# Altium schematic sheet Power_Section.SchDoc (part 1 of 3)
size 420 x 297 mm; SheetNumber: 2; SheetTotal: 3
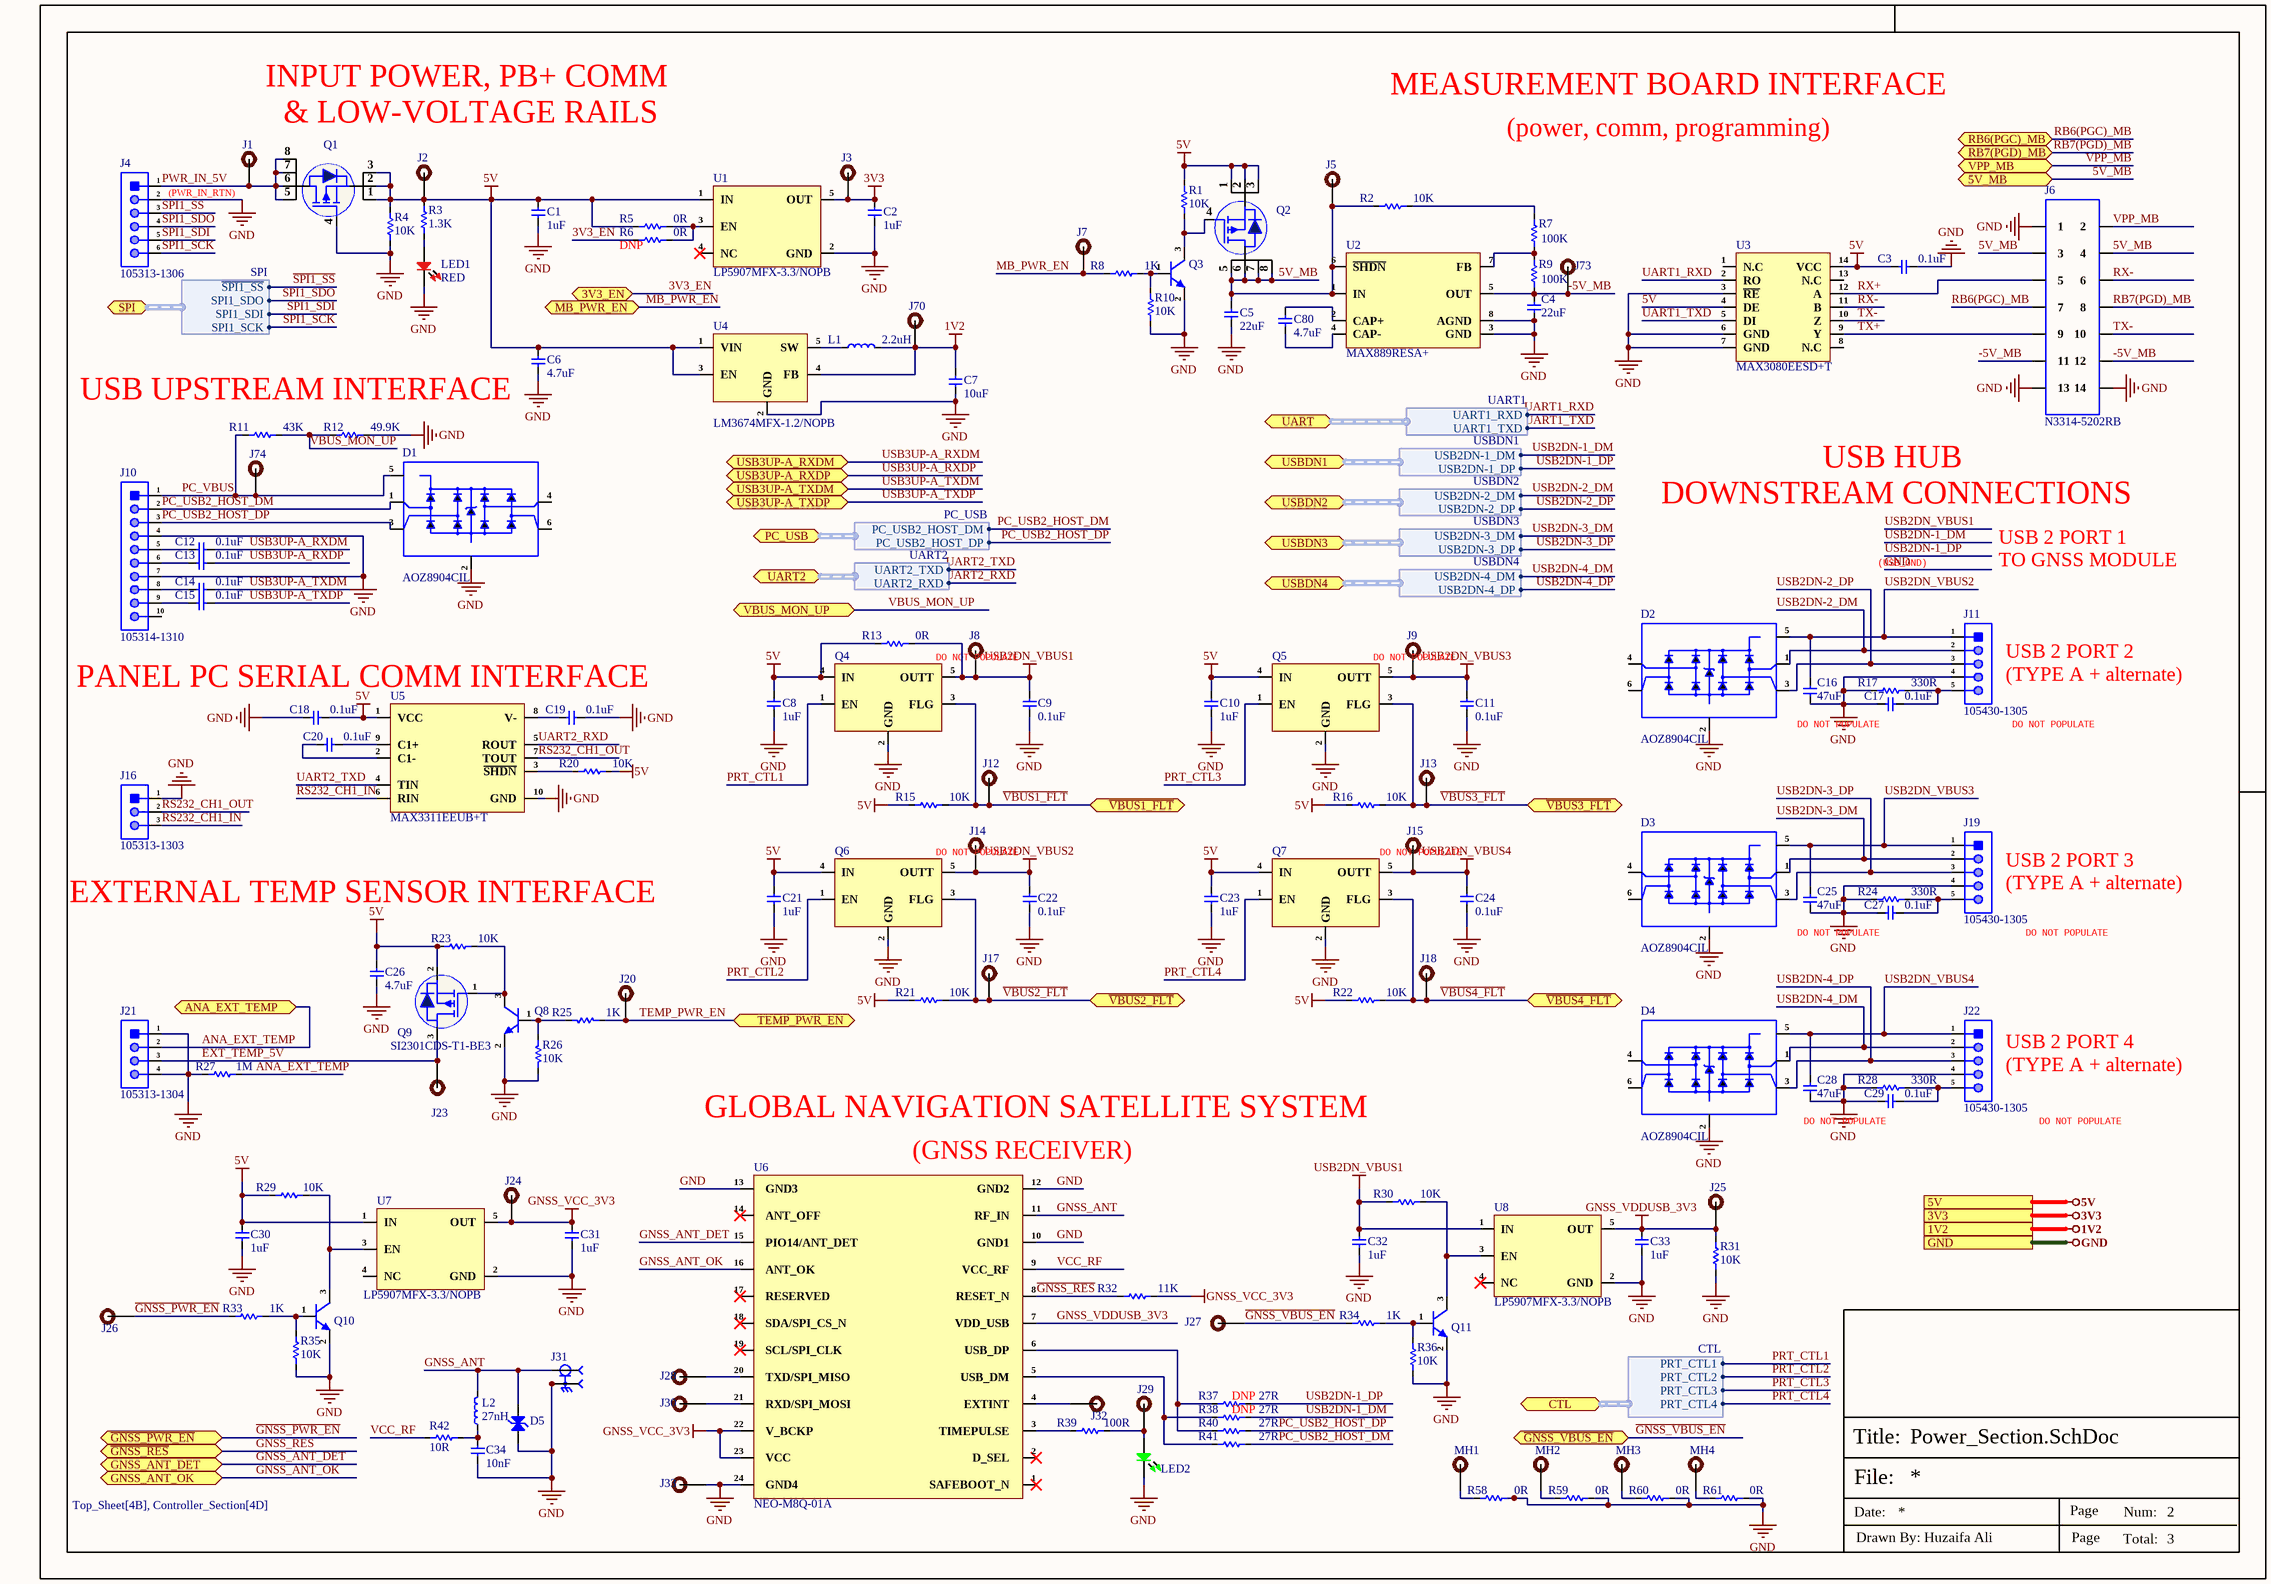
[diagram p0: Power_Section.SchDoc]

## Parts
C1  1uF  [Cap-0402]
C2  1uF  [Cap-0402]
C3  0.1uF  [Cap-0402]
C4  22uF  [Cap-0402]
C5  22uF  [Cap-0402]
C6  4.7uF  [Cap-0402]
C7  10uF  [Cap-0402]
C8  1uF  [Cap-0402]
C9  0.1uF  [Cap-0402]
C10  1uF  [Cap-0402]
C11  0.1uF  [Cap-0402]
C12  0.1uF  [Cap-0402]
C13  0.1uF  [Cap-0402]
C14  0.1uF  [Cap-0402]
C15  0.1uF  [Cap-0402]
C16  47uF  [Cap-0805]
C17  0.1uF  [Cap-0402]
C18  0.1uF  [Cap-0402]
C19  0.1uF  [Cap-0402]
C20  0.1uF  [Cap-0402]
C21  1uF  [Cap-0402]
C22  0.1uF  [Cap-0402]
C23  1uF  [Cap-0402]
C24  0.1uF  [Cap-0402]
C25  47uF  [Cap-0805]
C26  4.7uF  [Cap-0402]
C27  0.1uF  [Cap-0402]
C28  47uF  [Cap-0805]
C29  0.1uF  [Cap-0402]
C30  1uF  [Cap-0402]
C31  1uF  [Cap-0402]
C32  1uF  [Cap-0402]
C33  1uF  [Cap-0402]
C34  10nF  [Cap-0603]
C80  4.7uF  [Cap-0402]
D1  AOZ8904CIL  [SOT-23-6]
D2  AOZ8904CIL  [SOT-23-6]
D3  AOZ8904CIL  [SOT-23-6]
D4  AOZ8904CIL  [SOT-23-6]
D5  ACPDQC3V3HT-HF  [Diode 0402]  (value not drawn)
J1  Test Point -TH 1.8mm Hole size 0.92mm  [Test Point -TH 1.8mm Hole size 0.92mm]  (value not drawn)  (no BOM)
J2  Test Point -TH 1.8mm Hole size 0.92mm  [Test Point -TH 1.8mm Hole size 0.92mm]  (value not drawn)  (no BOM)
J3  Test Point -TH 1.8mm Hole size 0.92mm  [Test Point -TH 1.8mm Hole size 0.92mm]  (value not drawn)  (no BOM)
J4  105313-1306  [1053131306]
J5  Test Point -TH 1.8mm Hole size 0.92mm  [Test Point -TH 1.8mm Hole size 0.92mm]  (value not drawn)  (no BOM)
J6  N3314-5202RB  [N3314-5202RB]
J7  Test Point -TH 1.8mm Hole size 0.92mm  [Test Point -TH 1.8mm Hole size 0.92mm]  (value not drawn)  (no BOM)
J8  Test Point -TH 1.8mm Hole size 0.92mm  [Test Point -TH 1.8mm Hole size 0.92mm]  (value not drawn)  (no BOM)
J9  Test Point -TH 1.8mm Hole size 0.92mm  [Test Point -TH 1.8mm Hole size 0.92mm]  (value not drawn)  (no BOM)
J10  105314-1310  [1053141310]
J11  105430-1305  [1054301305]
J12  Test Point -TH 1.8mm Hole size 0.92mm  [Test Point -TH 1.8mm Hole size 0.92mm]  (value not drawn)  (no BOM)
J13  Test Point -TH 1.8mm Hole size 0.92mm  [Test Point -TH 1.8mm Hole size 0.92mm]  (value not drawn)  (no BOM)
J14  Test Point -TH 1.8mm Hole size 0.92mm  [Test Point -TH 1.8mm Hole size 0.92mm]  (value not drawn)  (no BOM)
J15  Test Point -TH 1.8mm Hole size 0.92mm  [Test Point -TH 1.8mm Hole size 0.92mm]  (value not drawn)  (no BOM)
J16  105313-1303  [1053131303]
J17  Test Point -TH 1.8mm Hole size 0.92mm  [Test Point -TH 1.8mm Hole size 0.92mm]  (value not drawn)  (no BOM)
J18  Test Point -TH 1.8mm Hole size 0.92mm  [Test Point -TH 1.8mm Hole size 0.92mm]  (value not drawn)  (no BOM)
J19  105430-1305  [1054301305]
J20  Test Point -TH 1.8mm Hole size 0.92mm  [Test Point -TH 1.8mm Hole size 0.92mm]  (value not drawn)  (no BOM)
J21  105313-1304  [1053131304]
J22  105430-1305  [1054301305]
J23  Test Point -TH 1.8mm Hole size 0.92mm  [Test Point -TH 1.8mm Hole size 0.92mm]  (value not drawn)  (no BOM)
J24  Test Point -TH 1.8mm Hole size 0.92mm  [Test Point -TH 1.8mm Hole size 0.92mm]  (value not drawn)  (no BOM)
J25  Test Point -TH 1.8mm Hole size 0.92mm  [Test Point -TH 1.8mm Hole size 0.92mm]  (value not drawn)  (no BOM)
J26  Test Point -TH 1.8mm Hole size 0.92mm  [Test Point -TH 1.8mm Hole size 0.92mm]  (value not drawn)  (no BOM)
J27  Test Point -TH 1.8mm Hole size 0.92mm  [Test Point -TH 1.8mm Hole size 0.92mm]  (value not drawn)  (no BOM)
J28  Test Point -TH 1.8mm Hole size 0.92mm  [Test Point -TH 1.8mm Hole size 0.92mm]  (value not drawn)  (no BOM)
J29  Test Point -TH 1.8mm Hole size 0.92mm  [Test Point -TH 1.8mm Hole size 0.92mm]  (value not drawn)  (no BOM)
J30  Test Point -TH 1.8mm Hole size 0.92mm  [Test Point -TH 1.8mm Hole size 0.92mm]  (value not drawn)  (no BOM)
J31  SMA-J-P-H-ST-TH1  [SMA-J-P-H-ST-TH1]  (value not drawn)
J32  Test Point -TH 1.8mm Hole size 0.92mm  [Test Point -TH 1.8mm Hole size 0.92mm]  (value not drawn)  (no BOM)
J33  Test Point -TH 1.8mm Hole size 0.92mm  [Test Point -TH 1.8mm Hole size 0.92mm]  (value not drawn)  (no BOM)
J70  Test Point -TH 1.8mm Hole size 0.92mm  [Test Point -TH 1.8mm Hole size 0.92mm]  (value not drawn)  (no BOM)
J73  Test Point -TH 1.8mm Hole size 0.92mm  [Test Point -TH 1.8mm Hole size 0.92mm]  (value not drawn)  (no BOM)
J74  Test Point -TH 1.8mm Hole size 0.92mm  [Test Point -TH 1.8mm Hole size 0.92mm]  (value not drawn)  (no BOM)
L1  2.2uH  [NR3012T2R2M]
L2  27nH  [IND-0603 (1608 Metric)]
LED1  RED  [LED-0603]
LED2  Emerald  [LED-0603]  (value not drawn)
MH1  M4 Mounting Hole  [M4 Mounting Hole]  (value not drawn)  (no BOM)
MH2  M4 Mounting Hole  [M4 Mounting Hole]  (value not drawn)  (no BOM)
MH3  M4 Mounting Hole  [M4 Mounting Hole]  (value not drawn)  (no BOM)
MH4  M4 Mounting Hole  [M4 Mounting Hole]  (value not drawn)  (no BOM)
Q1  SI4463DY  [SOIC-8]  (value not drawn)
Q2  SI4463DY  [SOIC-8]  (value not drawn)
Q3  MMBT2222ATT3G  [MMBT2222ATT3G]  (value not drawn)
Q4  AP22816BKAWT-7  [TSOT-25]  (value not drawn)
Q5  AP22816BKAWT-7  [TSOT-25]  (value not drawn)
Q6  AP22816BKAWT-7  [TSOT-25]  (value not drawn)
Q7  AP22816BKAWT-7  [TSOT-25]  (value not drawn)
Q8  MMBT2222ATT3G  [MMBT2222ATT3G]  (value not drawn)
Q9  SI2301CDS-T1-BE3  [SOT-23]
Q10  MMBT2222ATT3G  [MMBT2222ATT3G]  (value not drawn)
Q11  MMBT2222ATT3G  [MMBT2222ATT3G]  (value not drawn)
R1  10K  [Res-0402]
R2  10K  [Res-0402]
R3  1.3K  [Res-0402]
R4  10K  [Res-0402]
R5  0R  [Res-0402]
R6  0R  [Res-0402]
R7  100K  [Res-0402]
R8  1K  [Res-0402]
R9  100K  [Res-0402]
R10  10K  [Res-0402]
R11  43K  [Res-0402]
R12  49.9K  [Res-0402]
R13  0R  [Res-0402]
R15  10K  [Res-0402]
R16  10K  [Res-0402]
R17  330R  [Res-0402]
R20  10K  [Res-0402]
R21  10K  [Res-0402]
R22  10K  [Res-0402]
R23  10K  [Res-0402]
R24  330R  [Res-0402]
R25  1K  [Res-0402]
R26  10K  [Res-0402]
R27  1M  [Res-0402]
R28  330R  [Res-0402]
R29  10K  [Res-0402]
R30  10K  [Res-0402]
R31  10K  [Res-0402]
R32  11K  [Res-0402]
R33  1K  [Res-0402]
R34  1K  [Res-0402]
R35  10K  [Res-0402]
R36  10K  [Res-0402]
R37  27R  [Res-0402]
R38  27R  [Res-0402]
R39  100R  [Res-0402]
R40  27R  [Res-0402]
R41  27R  [Res-0402]
R42  10R  [Res-0402]
R58  0R  [Res-0805]
R59  0R  [Res-0805]
R60  0R  [Res-0805]
R61  0R  [Res-0805]
U1  LP5907MFX-3.3/NOPB  [SOT-23-5]
U2  MAX889RESA+  [SOIC-8(0.154", 3.90mm Width)]
U3  MAX3080EESD+T  [SOIC-14]
U4  LM3674MFX-1.2/NOPB  [SOT-23-5]
U5  MAX3311EEUB+T  [10-MSOP]
U6  NEO-M8Q-01A  [NEO-M8Q-01A]
U7  LP5907MFX-3.3/NOPB  [SOT-23-5]
U8  LP5907MFX-3.3/NOPB  [SOT-23-5]

## Ports
1V2 (see Top_Sheet[3A], Controller_Section[4D]), 3V3 (see Top_Sheet[3A], Controller_Section[4D]), 3V3_EN (bidir, see Top_Sheet[3B], Controller_Section[5C]), 5V (see Top_Sheet[3A], Controller_Section[4D]), 5V_MB (bidir, see Top_Sheet[3B], Controller_Section[4C]), ANA_EXT_TEMP (bidir, see Top_Sheet[4A], Controller_Section[4C]), CTL (bidir, harness CTL, see Top_Sheet[3C], Controller_Section[5D]), GND (see Top_Sheet[4C], Controller_Section[4D]), GNSS_ANT_DET (bidir, see Top_Sheet[4B], Controller_Section[4C]), GNSS_ANT_OK (bidir, see Top_Sheet[4B], Controller_Section[4D]), MB_PWR_EN (bidir, see Top_Sheet[3B], Controller_Section[4C]), PC_USB (bidir, harness PC_USB, see Top_Sheet[3C], Controller_Section[5C]), RB6(PGC)_MB (bidir, see Top_Sheet[3B], Controller_Section[4C]), RB7(PGD)_MB (bidir, see Top_Sheet[3B], Controller_Section[4C]), SPI (bidir, harness SPI, see Top_Sheet[3C], Controller_Section[5C]), TEMP_PWR_EN (bidir, see Top_Sheet[4B], Controller_Section[4D]), UART2 (bidir, harness UART2, see Top_Sheet[3C], Controller_Section[5C]), UART (bidir, harness UART1, see Top_Sheet[3C], Controller_Section[5C]), USB3UP-A_RXDM (bidir, see Top_Sheet[3B], Controller_Section[4C]), USB3UP-A_RXDP (bidir, see Top_Sheet[3B], Controller_Section[4C]), USB3UP-A_TXDM (bidir, see Top_Sheet[3B], Controller_Section[4C]), USB3UP-A_TXDP (bidir, see Top_Sheet[3B], Controller_Section[4C]), USBDN1 (bidir, harness USBDN1, see Top_Sheet[3C], Controller_Section[5C]), USBDN2 (bidir, harness USBDN2, see Top_Sheet[3C], Controller_Section[5C]), USBDN3 (bidir, harness USBDN3, see Top_Sheet[3C], Controller_Section[5C]), USBDN4 (bidir, harness USBDN4, see Top_Sheet[3C], Controller_Section[5C]), VBUS_MON_UP (bidir, see Top_Sheet[3C], Controller_Section[4C]), VPP_MB (bidir, see Top_Sheet[3B], Controller_Section[4C]), ~{GNSS_PWR_EN} (bidir, see Top_Sheet[4A], Controller_Section[4C]), ~{GNSS_RES} (bidir, see Top_Sheet[4B], Controller_Section[4C]), ~{GNSS_VBUS_EN} (bidir, see Top_Sheet[3B], Controller_Section[4C]), ~{VBUS1_FLT} (bidir, see Top_Sheet[3B], Controller_Section[4C]), ~{VBUS2_FLT} (bidir, see Top_Sheet[3B], Controller_Section[4C]), ~{VBUS3_FLT} (bidir, see Top_Sheet[3B], Controller_Section[4C]), ~{VBUS4_FLT} (bidir, see Top_Sheet[3B], Controller_Section[4C])

## Harnesses
CTL: PRT_CTL1, PRT_CTL2, PRT_CTL3, PRT_CTL4
SPI: SPI1_SDO, SPI1_SCK, SPI1_SDI, ~{SPI1_SS}
UART1: UART1_RXD, UART1_TXD
USBDN1: USB2DN-1_DM, USB2DN-1_DP
USBDN2: USB2DN-2_DM, USB2DN-2_DP
USBDN3: USB2DN-3_DM, USB2DN-3_DP
USBDN4: USB2DN-4_DM, USB2DN-4_DP
UART2: UART2_TXD, UART2_RXD
PC_USB: PC_USB2_HOST_DM, PC_USB2_HOST_DP

## Nets
1V2: C7.2 J70.1 L1.2 U4.4(FB) ; port 1V2
3V3: C2.1 J3.1 U1.5(OUT) ; port 3V3
5V: C1.1 C3.1 C6.2 C8.1 C10.1 C18.2 C21.1 C23.1 C26.2 C30.1 J2.1 Q1.1(S) Q1.2(S) Q1.3(S) Q2.1(S) Q2.2(S) Q2.3(S) Q4.4(IN) Q5.4(IN) Q6.4(IN) Q7.4(IN) Q9.2(S) R1.2 R3.2 R4.2 R5.1 R13.1 R15.2 R16.2 R20.1 R21.2 R22.2 R23.2 R29.2 U1.1(IN) U3.4(DE) U3.14(VCC) U4.1(VIN) U4.3(EN) U5.1(VCC) U7.1(IN) ; port 5V
GND: C1.2 C2.2 C3.2 C4.1 C5.1 C6.1 C7.1 C8.2 C9.2 C10.2 C11.2 C16.1 C17.1 C18.1 C19.2 C21.2 C22.2 C23.2 C24.2 C25.1 C26.1 C27.1 C28.1 C29.1 C30.2 C31.2 C32.2 C33.2 C34.2 D1.2(VN) D2.2(VN) D3.2(VN) D4.2(VN) D5.1(A) J4.2 J6.1 J6.13 J6.14 J10.4 J10.7 J11.4 J16.1 J19.4 J21.1 J21.4 J22.4 J31.2 J31.3 J31.4 J31.5 J33.1 LED1.2 LED2.2 Q1.4(G) Q3.2(E) Q4.2(GND) Q5.2(GND) Q6.2(GND) Q7.2(GND) Q8.2(E) Q10.2(E) Q11.2(E) R4.1 R10.1 R12.2 R17.1 R24.1 R26.1 R27.1 R28.1 R31.1 R35.1 R36.1 R58.1 R59.1 R60.1 R61.1 U1.2(GND) U2.3(GND) U2.8(AGND) U3.3(~{RE}) U3.6(GND) U3.7(GND) U4.2(GND) U5.10(GND) U6.10(GND1) U6.12(GND2) U6.13(GND3) U6.24(GND4) U7.2(GND) U8.2(GND) ; port GND
GNSS_VCC_3V3: C31.1 J24.1 R32.2 U6.22(V_BCKP) U6.23(VCC) U7.5(OUT)
GNSS_VDDUSB_3V3: C33.1 J25.1 R31.2 U6.7(VDD_USB) U8.5(OUT)
USB2DN_VBUS1: C9.1 C32.1 J8.1 Q4.5(OUTT) R13.2 R30.2 U8.1(IN)
USB2DN_VBUS2: C16.2 C22.1 D2.5(VP) J11.1 J14.1 Q6.5(OUTT)
USB2DN_VBUS3: C11.1 C25.2 D3.5(VP) J9.1 J19.1 Q5.5(OUTT)
USB2DN_VBUS4: C24.1 C28.2 D4.5(VP) J15.1 J22.1 Q7.5(OUTT)
3V3_EN: R6.1 ; port 3V3_EN
5V_MB: C5.2 J5.1 J6.3 J6.4 Q2.5(D) Q2.6(D) Q2.7(D) Q2.8(D) R2.2 U2.1(IN) U2.6(~{SHDN}) ; port 5V_MB
-5V_MB: C4.2 J6.11 J6.12 J73.1 R9.1 U2.5(OUT)
ANA_EXT_TEMP: J21.2 R27.2 ; port ANA_EXT_TEMP
EXT_TEMP_5V: J21.3 J23.1 Q9.3(D)
~{GNSS_PWR_EN}: J26.1 R33.1 ; port ~{GNSS_PWR_EN}
~{GNSS_RES}: R32.1 U6.8(RESET_N) ; port ~{GNSS_RES}
~{GNSS_VBUS_EN}: J27.1 R34.1 ; port ~{GNSS_VBUS_EN}
GNSS_ANT: D5.2(A) J31.1 L2.2 U6.11(RF_IN)
GNSS_ANT_DET: U6.15(PIO14/ANT_DET) ; port GNSS_ANT_DET
GNSS_ANT_OK: U6.16(ANT_OK) ; port GNSS_ANT_OK
MB_PWR_EN: J7.1 R8.1 ; port MB_PWR_EN
PC_USB2_HOST_DM: D1.1(CH1) J10.2 R41.2 ; port PC_USB.PC_USB2_HOST_DM
PC_USB2_HOST_DP: D1.3(CH2) J10.3 R40.2 ; port PC_USB.PC_USB2_HOST_DP
PC_VBUS: D1.5(VP) J10.1 J74.1 R11.1
PRT_CTL1: Q4.1(EN) ; port CTL.PRT_CTL1
PRT_CTL2: Q6.1(EN) ; port CTL.PRT_CTL2
PRT_CTL3: Q5.1(EN) ; port CTL.PRT_CTL3
PRT_CTL4: Q7.1(EN) ; port CTL.PRT_CTL4
PWR_IN_5V: J1.1 J4.1 Q1.5(D) Q1.6(D) Q1.7(D) Q1.8(D)
RB6(PGC)_MB: J6.7 ; port RB6(PGC)_MB
RB7(PGD)_MB: J6.8 ; port RB7(PGD)_MB
RS232_CH1_IN: J16.3 U5.6(RIN)
RS232_CH1_OUT: J16.2 U5.7(TOUT)
RX+: J6.5 U3.12(A)
RX-: J6.6 U3.11(B)
~{SPI1_SS}: J4.3 ; port SPI.~{SPI1_SS}
SPI1_SCK: J4.6 ; port SPI.SPI1_SCK
SPI1_SDI: J4.5 ; port SPI.SPI1_SDI
SPI1_SDO: J4.4 ; port SPI.SPI1_SDO
TEMP_PWR_EN: J20.1 R25.1 ; port TEMP_PWR_EN
TX+: J6.9 U3.9(Y)
TX-: J6.10 U3.10(Z)
UART1_RXD: U3.2(RO) ; port UART.UART1_RXD
UART1_TXD: U3.5(DI) ; port UART.UART1_TXD
UART2_RXD: U5.5(ROUT) ; port UART2.UART2_RXD
UART2_TXD: U5.4(TIN) ; port UART2.UART2_TXD
USB2DN-1_DM: R38.2 ; port USBDN1.USB2DN-1_DM
USB2DN-1_DP: R37.2 ; port USBDN1.USB2DN-1_DP
USB2DN-2_DM: D2.1(CH1) J11.2 ; port USBDN2.USB2DN-2_DM
USB2DN-2_DP: D2.3(CH2) J11.3 ; port USBDN2.USB2DN-2_DP
USB2DN-3_DM: D3.1(CH1) J19.2 ; port USBDN3.USB2DN-3_DM
USB2DN-3_DP: D3.3(CH2) J19.3 ; port USBDN3.USB2DN-3_DP
USB2DN-4_DM: D4.1(CH1) J22.2 ; port USBDN4.USB2DN-4_DM
USB2DN-4_DP: D4.3(CH2) J22.3 ; port USBDN4.USB2DN-4_DP
USB3UP-A_RXDM: C12.2 ; port USB3UP-A_RXDM
USB3UP-A_RXDP: C13.2 ; port USB3UP-A_RXDP
USB3UP-A_TXDM: C14.2 ; port USB3UP-A_TXDM
USB3UP-A_TXDP: C15.2 ; port USB3UP-A_TXDP
~{VBUS1_FLT}: J12.1 Q4.3(FLG) R15.1 ; port ~{VBUS1_FLT}
~{VBUS2_FLT}: J17.1 Q6.3(FLG) R21.1 ; port ~{VBUS2_FLT}
~{VBUS3_FLT}: J13.1 Q5.3(FLG) R16.1 ; port ~{VBUS3_FLT}
~{VBUS4_FLT}: J18.1 Q7.3(FLG) R22.1 ; port ~{VBUS4_FLT}
VBUS_MON_UP: R11.2 R12.1 ; port VBUS_MON_UP
VCC_RF: R42.1 U6.9(VCC_RF)
VPP_MB: J6.2 ; port VPP_MB
NetC12_1: C12.1 J10.5
NetC13_1: C13.1 J10.6
NetC14_1: C14.1 J10.8
NetC15_1: C15.1 J10.9
NetC17_2: C17.2 J11.5 R17.2
NetC19_1: C19.1 U5.8(V-)
NetC20_1: C20.1 U5.2(C1-)
NetC20_2: C20.2 U5.9(C1+)
NetC27_2: C27.2 J19.5 R24.2
NetC29_2: C29.2 J22.5 R28.2
NetC34_1: C34.1 L2.1 R42.2
NetC80_1: C80.1 U2.4(CAP-)
NetC80_2: C80.2 U2.2(CAP+)
NetJ28_1: J28.1 U6.20(TXD/SPI_MISO)
NetJ29_1: J29.1 LED2.1 R39.2
NetJ30_1: J30.1 U6.21(RXD/SPI_MOSI)
NetJ32_1: J32.1 U6.4(EXTINT)
NetL1_1: L1.1 U4.5(SW)
NetLED1_1: LED1.1 R3.1
NetMH1_MH: MH1.MH R58.2
NetMH2_MH: MH2.MH R59.2
NetMH3_MH: MH3.MH R60.2
NetMH4_MH: MH4.MH R61.2
NetQ2_4: Q2.4(G) Q3.3(C) R1.1
NetQ3_1: Q3.1(B) R8.2 R10.2
NetQ8_1: Q8.1(B) R25.2 R26.2
NetQ8_3: Q8.3(C) Q9.1(G) R23.1
NetQ10_1: Q10.1(B) R33.2 R35.2
NetQ10_3: Q10.3(C) R29.1 U7.3(EN)
NetQ11_1: Q11.1(B) R34.2 R36.2
NetQ11_3: Q11.3(C) R30.1 U8.3(EN)
NetR2_1: R2.1 R7.2
NetR5_2: R5.2 R6.2 U1.3(EN)
NetR7_1: R7.1 R9.2 U2.7(FB)
NetR20_2: R20.2 U5.3(~{SHDN})
NetR37_1: R37.1 R40.1 U6.6(USB_DP)
NetR38_1: R38.1 R41.1 U6.5(USB_DM)
NetR39_1: R39.1 U6.3(TIMEPULSE)

Not connected (* = marked no-connect by the designer): D1 4(CH3) 6(CH4); D2 4(CH3) 6(CH4); D3 4(CH3) 6(CH4); D4 4(CH3) 6(CH4); J10 10; U1 4(NC)*; U3 1(N.C) 8(N.C) 13(N.C); U6 1(SAFEBOOT_N)* 2(D_SEL)* 14(ANT_OFF)* 17(RESERVED)* 18(SDA/SPI_CS_N)* 19(SCL/SPI_CLK)*; U7 4(NC); U8 4(NC)*

## Notes on the sheet
- INPUT POWER, PB+ COMM
  & LOW-VOLTAGE RAILS
- MEASUREMENT BOARD INTERFACE
- (power, comm, programming)
- (near J4) (PWR_IN_RTN)
- (near R6) DNP
- USB UPSTREAM INTERFACE
- (near J6) USB HUB
  DOWNSTREAM CONNECTIONS
- (USB_GND)
- USB 2 PORT 1
  TO GNSS MODULE
- DO NOT POPULATE
- (near Q5) DO NOT POPULATE
- PANEL PC SERIAL COMM INTERFACE
- (near D2) DO NOT POPULATE
- (near J11) USB 2 PORT 2
  (TYPE A + alternate)
- (near Q6) DO NOT POPULATE
- (near Q7) DO NOT POPULATE
- EXTERNAL TEMP SENSOR INTERFACE
- (near D3) DO NOT POPULATE
- (near J19) USB 2 PORT 3
  (TYPE A + alternate)
- (near J19) DO NOT POPULATE
- (near J22) USB 2 PORT 4
  (TYPE A + alternate)
- GLOBAL NAVIGATION SATELLITE SYSTEM
- (near D4) DO NOT POPULATE
- (near J22) DO NOT POPULATE
- (near U6) (GNSS RECEIVER)
- (near R37) DNP
- DNP
- File:
- Title:
- Date:
- Page
- Num:
- Total:
- Drawn By: Huzaifa Ali